# Altium schematic sheet STM32F407.SchDoc
size A4
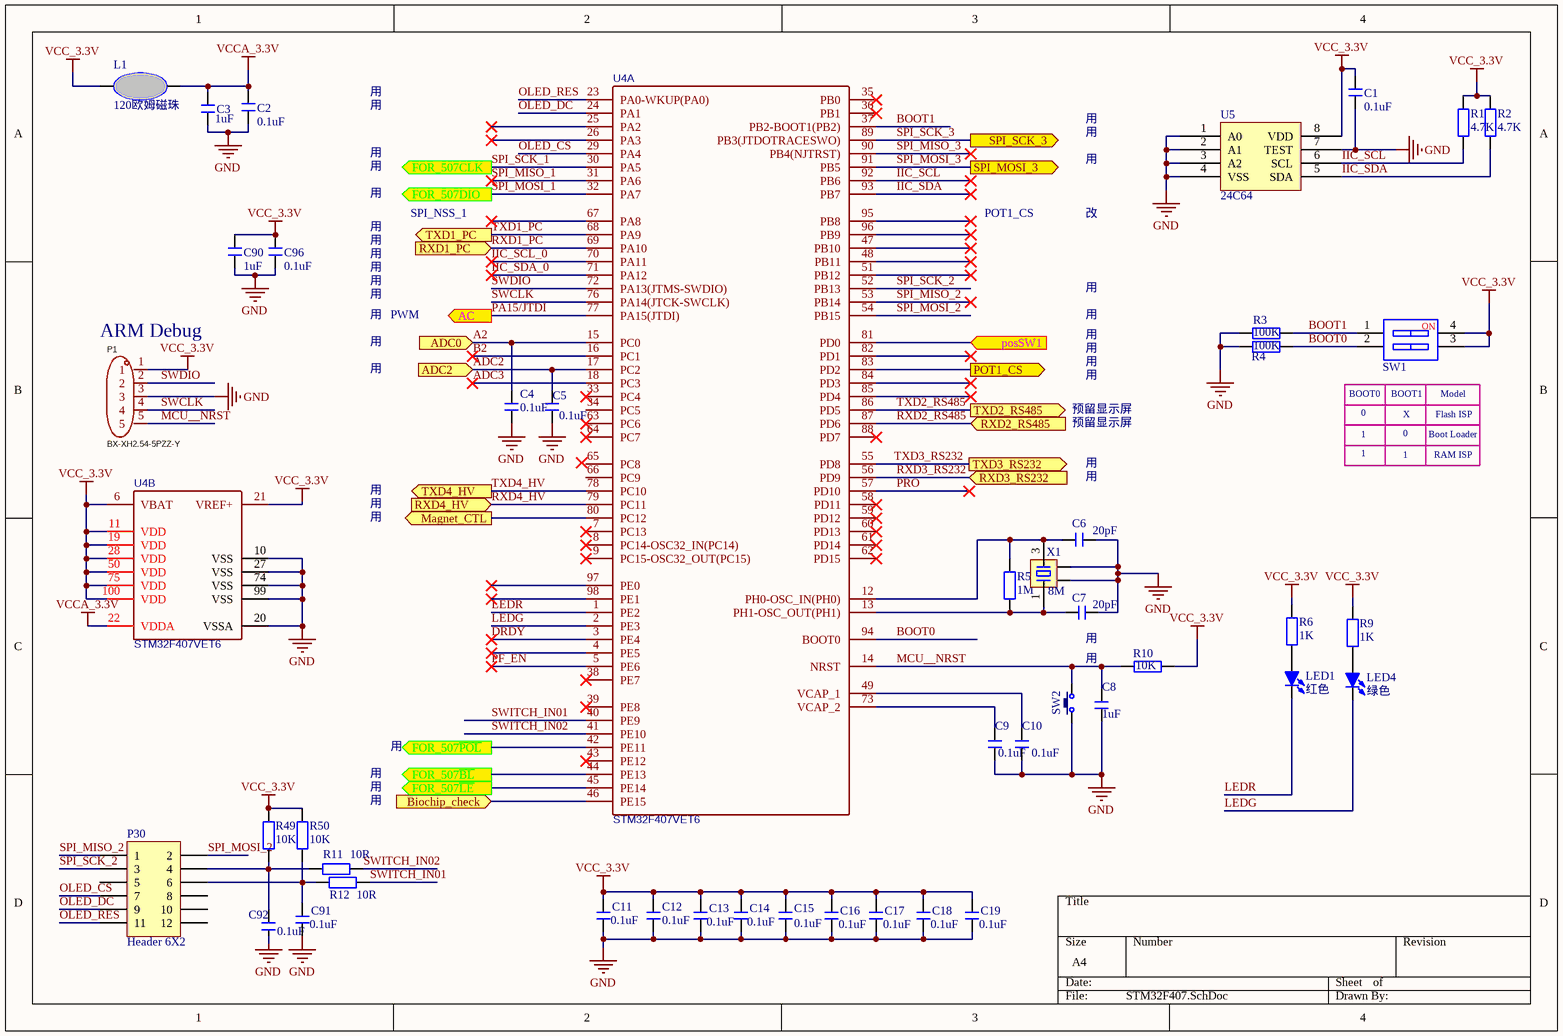
[diagram p0: STM32F407.SchDoc]

## Parts
C1  0.1uF  [C 0603]
C2  0.1uF  [C 0603]
C3  1uF  [C 0603]
C4  0.1uF  [C 0603]
C5  0.1uF  [C 0603]
C6  20pF  [C 0603]
C7  20pF  [C 0603]
C8  1uF  [C 0603]
C9  0.1uF  [C 0603]
C10  0.1uF  [C 0603]
C11  0.1uF  [C 0603]
C12  0.1uF  [C 0603]
C13  0.1uF  [C 0603]
C14  0.1uF  [C 0603]
C15  0.1uF  [C 0603]
C16  0.1uF  [C 0603]
C17  0.1uF  [C 0603]
C18  0.1uF  [C 0603]
C19  0.1uF  [C 0603]
C90  1uF  [C 0603]
C91  0.1uF  [C 0603]
C92  0.1uF  [C 0603]
C96  0.1uF  [C 0603]
L1  120欧姆磁珠  [L 0603]
LED1  红色  [LED 0603R]
LED4  绿色  [LED 0603G]
P1  BX-XH2.54-5PZZ-Y  [CONN-TH_BX-XH2.54-5PZZ-Y]
P30  Header 6X2  [HDR-6X2]
R1  4.7K  [R 0603]
R2  4.7K  [R 0603]
R3  100K  [R 0603]
R4  100K  [R 0603]
R5  1M  [R 0603]
R6  1K  [R 0603]
R9  1K  [R 0603]
R10  10K  [R 0603]
R11  10R  [R 0603]
R12  10R  [R 0603]
R49  10K  [R 0603]
R50  10K  [R 0603]
SW1  CSW-2P  [CSW1.27 SMD-2P]  (value not drawn)
SW2  3x6x5  [TSW SMD-3*6*2.5]  (value not drawn)
U4  STM32F407VET6  [LQFP100 14x14_N]  (parts A,B of 2)
U5  24C64  [SOP8_N]
X1  8M  [XTAL-3225]

## Ports
AC (out), ADC0 (in), ADC2 (in), Biochip_check (in), FOR_507CLK (out), FOR_507DIO (out), FOR_507~{BL} (out), FOR_507~{LE} (out), FOR_507~{POL} (out), Magnet_CTL (out), posSW1 (in), POT1_CS (out), RXD1_PC (in), RXD2_RS485 (in), RXD3_RS232 (in), RXD4_HV (in), SPI_MOSI_3 (out), SPI_SCK_3 (out), TXD1_PC (out), TXD2_RS485 (out), TXD3_RS232 (out), TXD4_HV (out)

## Nets
GND: C1.1 C2.1 C3.1 C4.1 C5.1 C6.1 C7.1 C8.1 C9.1 C10.1 C11.1 C12.1 C13.1 C14.1 C15.1 C16.1 C17.1 C18.1 C19.1 C90.2 C91.1 C92.1 C96.2 P1.3 R3.2 R4.2 SW2.1 U4.10(VSS) U4.20(VSSA) U4.27(VSS) U4.74(VSS) U4.99(VSS) U5.1(A0) U5.2(A1) U5.3(A2) U5.4(VSS) U5.7(TEST) X1.2 X1.4
VCC_3.3V: C1.2 C11.2 C12.2 C13.2 C14.2 C15.2 C16.2 C17.2 C18.2 C19.2 C90.1 C96.1 L1.1 P1.1 R1.1 R2.1 R6.1 R9.1 R10.1 R49.1 R50.2 SW1.3 SW1.4 U4.6(VBAT) U4.11(VDD) U4.19(VDD) U4.21(VREF+) U4.28(VDD) U4.50(VDD) U4.75(VDD) U4.100(VDD) U5.8(VDD)
VCCA_3.3V: C2.2 C3.2 L1.2 U4.22(VDDA)
A2: C4.2 U4.15(PC0) ; port ADC0
ADC2: C5.2 U4.17(PC2) ; port ADC2
ADC3: U4.18(PC3)
B2: U4.16(PC1)
Biochip_check: U4.46(PE15) ; port Biochip_check
BOOT0: R4.1 SW1.2 U4.94(BOOT0)
BOOT1: R3.1 SW1.1 U4.37(PB2-BOOT1(PB2))
DRDY: U4.3(PE4)
FOR_507~{BL}: U4.44(PE13) ; port FOR_507~{BL}
FOR_507~{LE}: U4.45(PE14) ; port FOR_507~{LE}
FOR_507~{POL}: U4.42(PE11) ; port FOR_507~{POL}
IIC_SCL: R1.2 U4.92(PB6) U5.6(SCL)
IIC_SCL_0: U4.70(PA11)
IIC_SDA: R2.2 U4.93(PB7) U5.5(SDA)
IIC_SDA_0: U4.71(PA12)
LEDG: LED4.2(K) U4.2(PE3)
LEDR: LED1.2(K) U4.1(PE2)
Magnet_CTL: U4.80(PC12) ; port Magnet_CTL
MCU＿NRST: C8.2 P1.5 R10.2 SW2.2 U4.14(NRST)
OLED_CS: P30.7 U4.29(PA4)
OLED_DC: P30.9 U4.24(PA1)
OLED_RES: P30.11 U4.23(PA0-WKUP(PA0))
PA15/JTDI: U4.77(PA15(JTDI)) ; port AC
PF_EN: U4.5(PE6)
posSW1: U4.81(PD0) ; port posSW1
POT1_CS: U4.83(PD2) ; port POT1_CS
PRO: U4.57(PD10)
RXD1_PC: U4.69(PA10) ; port RXD1_PC
RXD2_RS485: U4.87(PD6) ; port RXD2_RS485
RXD3_RS232: U4.56(PD9) ; port RXD3_RS232
RXD4_HV: U4.79(PC11) ; port RXD4_HV
SPI_MISO_1: U4.31(PA6)
SPI_MISO_2: P30.1 U4.53(PB14)
SPI_MISO_3: U4.90(PB4(NJTRST))
SPI_MOSI_1: U4.32(PA7) ; port FOR_507DIO
SPI_MOSI_2: P30.2 U4.54(PB15)
SPI_MOSI_3: U4.91(PB5) ; port SPI_MOSI_3
SPI_SCK_1: U4.30(PA5) ; port FOR_507CLK
SPI_SCK_2: P30.3 U4.52(PB13)
SPI_SCK_3: U4.89(PB3(JTDOTRACESWO)) ; port SPI_SCK_3
SWCLK: P1.4 U4.76(PA14(JTCK-SWCLK))
SWDIO: P1.2 U4.72(PA13(JTMS-SWDIO))
SWITCH_IN01: R12.2 U4.40(PE9)
SWITCH_IN02: R11.2 U4.41(PE10)
TXD1_PC: U4.68(PA9) ; port TXD1_PC
TXD2_RS485: U4.86(PD5) ; port TXD2_RS485
TXD3_RS232: U4.55(PD8) ; port TXD3_RS232
TXD4_HV: U4.78(PC10) ; port TXD4_HV
NetC6_2: C6.2 R5.1 U4.12(PH0-OSC_IN(PH0)) X1.3
NetC7_2: C7.2 R5.2 U4.13(PH1-OSC_OUT(PH1)) X1.1
NetC9_2: C9.2 U4.73(VCAP_2)
NetC10_2: C10.2 U4.49(VCAP_1)
NetC91_2: C91.2 P30.6 R12.1 R50.1
NetC92_2: C92.2 P30.4 R11.1 R49.2
NetLED1_1: LED1.1(A) R6.2
NetLED4_1: LED4.1(A) R9.2

Not connected (* = marked no-connect by the designer): P30 5 8 10 12; U4 4(PE5)* 7(PC13)* 8(PC14-OSC32_IN(PC14))* 9(PC15-OSC32_OUT(PC15))* 25(PA2)* 26(PA3)* 33(PC4)* 34(PC5) 35(PB0)* 36(PB1)* 38(PE7)* 39(PE8)* 43(PE12)* 47(PB10)* 48(PB11)* 51(PB12)* 58(PD11)* 59(PD12)* 60(PD13)* 61(PD14)* 62(PD15)* 63(PC6)* 64(PC7)* 65(PC8) 66(PC9) 67(PA8)* 82(PD1)* 84(PD3)* 85(PD4)* 88(PD7)* 95(PB8)* 96(PB9)* 97(PE0)* 98(PE1)*

## Notes on the sheet
- 用
- SPI_NSS_1
- POT1_CS
- 改
- (near P1) ARM Debug
- PWM
- 预留显示屏
- (near SW1) BOOT0
- 0
- 1
- (near SW1) BOOT1
- X
- Boot Loader
- Flash ISP
- (near SW1) Model
- RAM ISP
- (near C7) 用
- (in symbol CSW-2P) NO

## Library data of the parts
C1-C19 C91 C92 = C: 无极性贴片电容; 版权归属: 源创客; BOM名称: 无极性贴片电容; 学习资源: www.ooocke.com
C90 C96 = C-CC: 直插瓷片电容; 版权归属: 源创客; BOM名称: 直插瓷片电容; 学习资源: www.ooocke.com
L1 = FERRITBEAD
LED1 LED4 = LED-SMD: 贴片LED; 版权归属: 源创客; BOM名称: 贴片LED; 学习资源: www.ooocke.com
P1 = BX-XH2.54-5PZZ-Y: Add into BOM: yes; Pins Structure: 1x5P; Pitch: 2.54mm; Reference Series: XH; Number of PINs Per Row: 5; Rated Voltage (Max): 250V; Plastic Material: PA66; Symbol: BX-XH2.54-5PZZ-Y; Device: BX-XH2.54-5PZZ-Y; Supplier Part: C22388511; Manufacturer Part: BX-XH2.54-5PZZ-Y; JLCPCB Part Class: Extended Part; Datasheet: https://atta.szlcsc.com/upload/public/pdf/source/20240429/3EA06438A1F774359BF6390646FD240A.pdf; Supplier: LCSC; Convert to PCB: yes; Number of Pins: 5P; Number of Rows: 1
P30 = Header 6X2: Header, 6-Pin, Dual row; LatestRevisionDate: 17-Jul-2002; LatestRevisionNote: Re-released for DXP Platform.; Publisher: Altium Limited
R1-R6 R9-R12 R49 R50 = R: 贴片电阻; 版权归属: 源创客; BOM名称: 贴片电阻; 学习资源: www.ooocke.com
SW1 = CSW-2P: 2路编码开关; 版权归属: 源创客; BOM名称: 2路编码开关; 学习资源: www.ooocke.com
SW2 = TSW 3x6: 3x6轻触开关; 版权归属: 源创客; BOM名称: 3x6轻触开关; 学习资源: www.ooocke.com
U4 = STM32F407VET6: BOM_Manufacturer: ST; subpart_no: 1; tags: STM32; BOM_Supplier Part: C28730; BOM_Supplier: LCSC; BOM_Manufacturer Part: STM32F407VET6; image: http://image.lceda.cn/szlcsc/C28730.jpg; BOM_JLCPCB Part Class: Extended Part; spicePre: U; spiceSymbolName: STM32F407VET6
U5 = 24LC02
X1 = XTAL-4: 4脚晶振; 版权归属: 源创客; BOM名称: 4脚晶振; 学习资源: www.ooocke.com